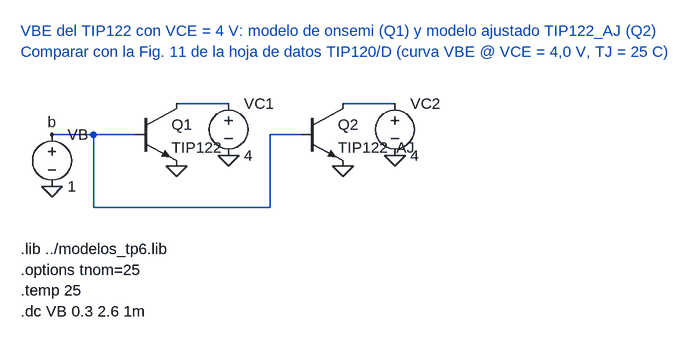
[diagram p0: schematic vbe_tip122.asc]
vbe_tip122.asc, the LTspice schematic file:
Version 4
SHEET 1 900 520
WIRE 64 176 192 176
WIRE 128 176 128 288
WIRE 128 288 400 288
WIRE 400 288 400 176
WIRE 400 176 448 176
WIRE 256 128 336 128
WIRE 512 128 592 128
FLAG 64 256 0
FLAG 256 224 0
FLAG 512 224 0
FLAG 336 208 0
FLAG 592 208 0
FLAG 64 176 b
SYMBOL voltage 64 160 R0
SYMATTR InstName VB
SYMATTR Value 1
SYMBOL npn 192 128 R0
SYMATTR InstName Q1
SYMATTR Value TIP122
SYMATTR Prefix X
SYMBOL npn 448 128 R0
SYMATTR InstName Q2
SYMATTR Value TIP122_AJ
SYMATTR Prefix X
SYMBOL voltage 336 112 R0
SYMATTR InstName VC1
SYMATTR Value 4
SYMBOL voltage 592 112 R0
SYMATTR InstName VC2
SYMATTR Value 4
TEXT 16 16 Left 2 ;VBE del TIP122 con VCE = 4 V: modelo de onsemi (Q1) y modelo ajustado TIP122_AJ (Q2)
TEXT 16 48 Left 2 ;Comparar con la Fig. 11 de la hoja de datos TIP120/D (curva VBE @ VCE = 4,0 V, TJ = 25 C)
TEXT 16 352 Left 2 !.lib ../modelos_tp6.lib
TEXT 16 384 Left 2 !.options tnom=25
TEXT 16 416 Left 2 !.temp 25
TEXT 16 448 Left 2 !.dc VB 0.3 2.6 1m

The netlist it stands for:
* vbe_tip122.asc
VB b 0 1
XQ1 N001 b 0 TIP122  ; pins C B E
XQ2 N002 b 0 TIP122_AJ  ; pins C B E
VC1 N001 0 4
VC2 N002 0 4
* VBE del TIP122 con VCE = 4 V: modelo de onsemi (Q1) y modelo ajustado TIP122_AJ (Q2)
* Comparar con la Fig. 11 de la hoja de datos TIP120/D (curva VBE @ VCE = 4,0 V, TJ = 25 C)
.lib ../modelos_tp6.lib
.options tnom=25
.temp 25
.dc VB 0.3 2.6 1m
.backanno
.end